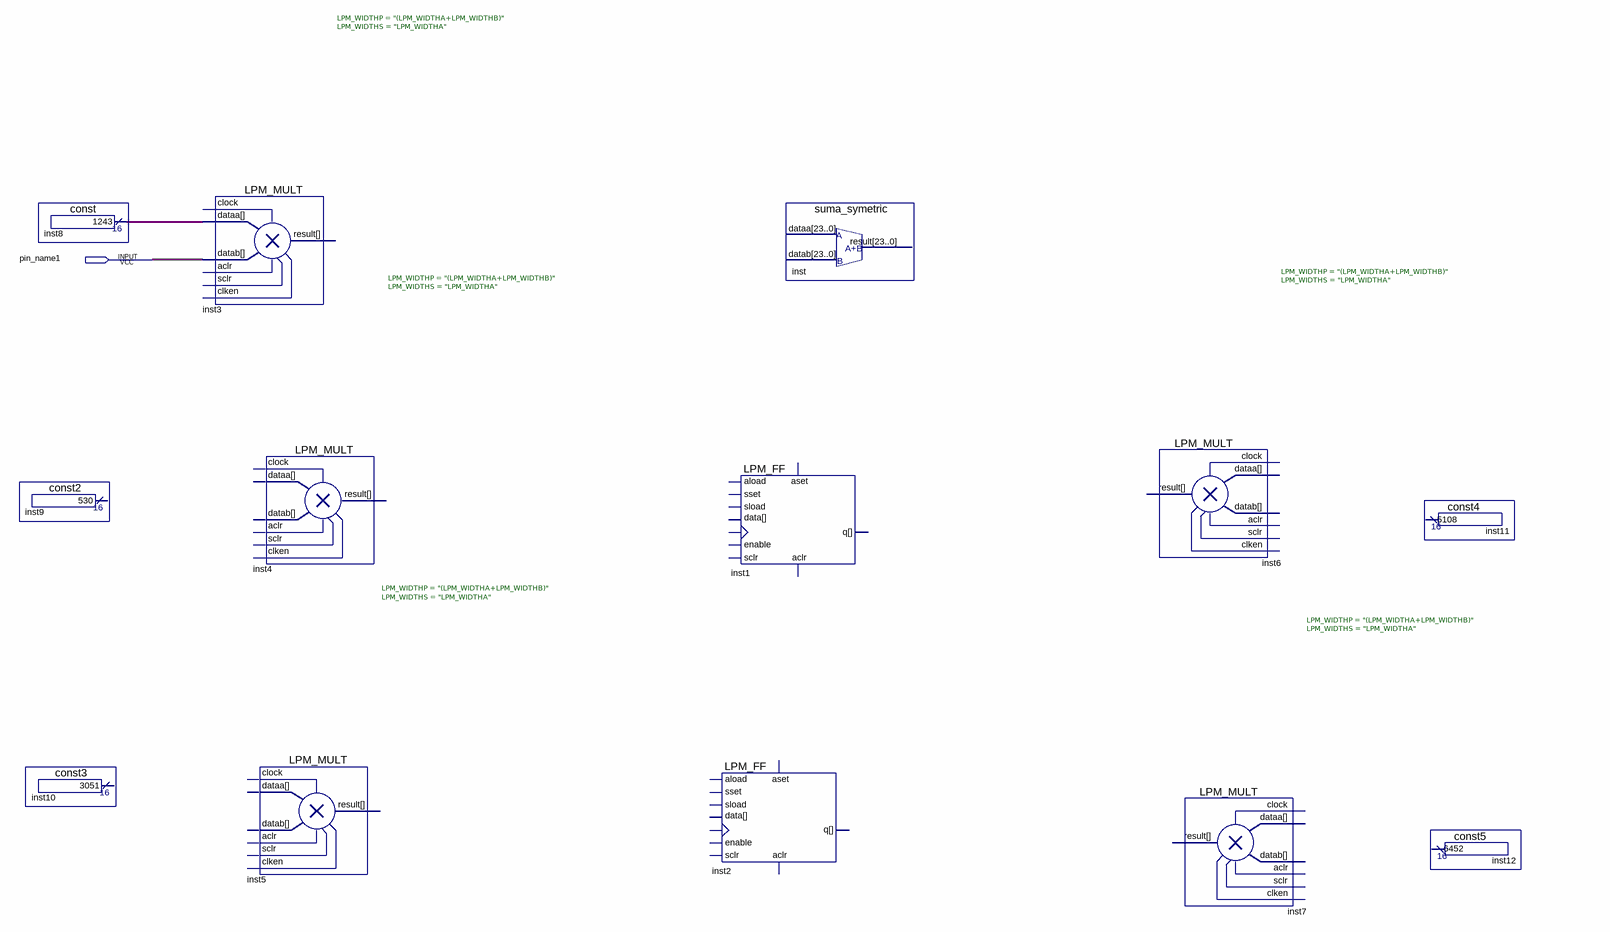
[diagram p0: schematic sheet]
// Quartus schematic first_order.bdf as structural Verilog: 13 symbols, 1 pins
module first_order (
  input  pin_name1
);

  wire [15:0] inst8_result;

  \const  inst8 (.result(inst8_result));
  const2 inst9 ();  // open: result
  const3 inst10 ();  // open: result
  LPM_MULT #(.LPM_WIDTHP("(LPM_WIDTHA+LPM_WIDTHB)"), .LPM_WIDTHS("LPM_WIDTHA")) inst3 (
    .dataa(inst8_result), .datab(pin_name1));  // open: clock, aclr, sclr, clken, result
  LPM_MULT #(.LPM_WIDTHP("(LPM_WIDTHA+LPM_WIDTHB)"), .LPM_WIDTHS("LPM_WIDTHA")) inst5 ();  // open: clock, dataa, datab, aclr, sclr, clken, result
  LPM_MULT #(.LPM_WIDTHP("(LPM_WIDTHA+LPM_WIDTHB)"), .LPM_WIDTHS("LPM_WIDTHA")) inst4 ();  // open: clock, dataa, datab, aclr, sclr, clken, result
  LPM_FF inst1 ();  // open: enable, clock, aload, sset, sload, aset, sclr, aclr, data, q
  LPM_FF inst2 ();  // open: enable, clock, aload, sset, sload, aset, sclr, aclr, data, q
  suma_symetric inst ();  // open: dataa, datab, result
  LPM_MULT #(.LPM_WIDTHP("(LPM_WIDTHA+LPM_WIDTHB)"), .LPM_WIDTHS("LPM_WIDTHA")) inst6 ();  // open: clock, dataa, datab, aclr, sclr, clken, result
  LPM_MULT #(.LPM_WIDTHP("(LPM_WIDTHA+LPM_WIDTHB)"), .LPM_WIDTHS("LPM_WIDTHA")) inst7 ();  // open: clock, dataa, datab, aclr, sclr, clken, result
  const4 inst11 ();  // open: result
  const5 inst12 ();  // open: result
endmodule
